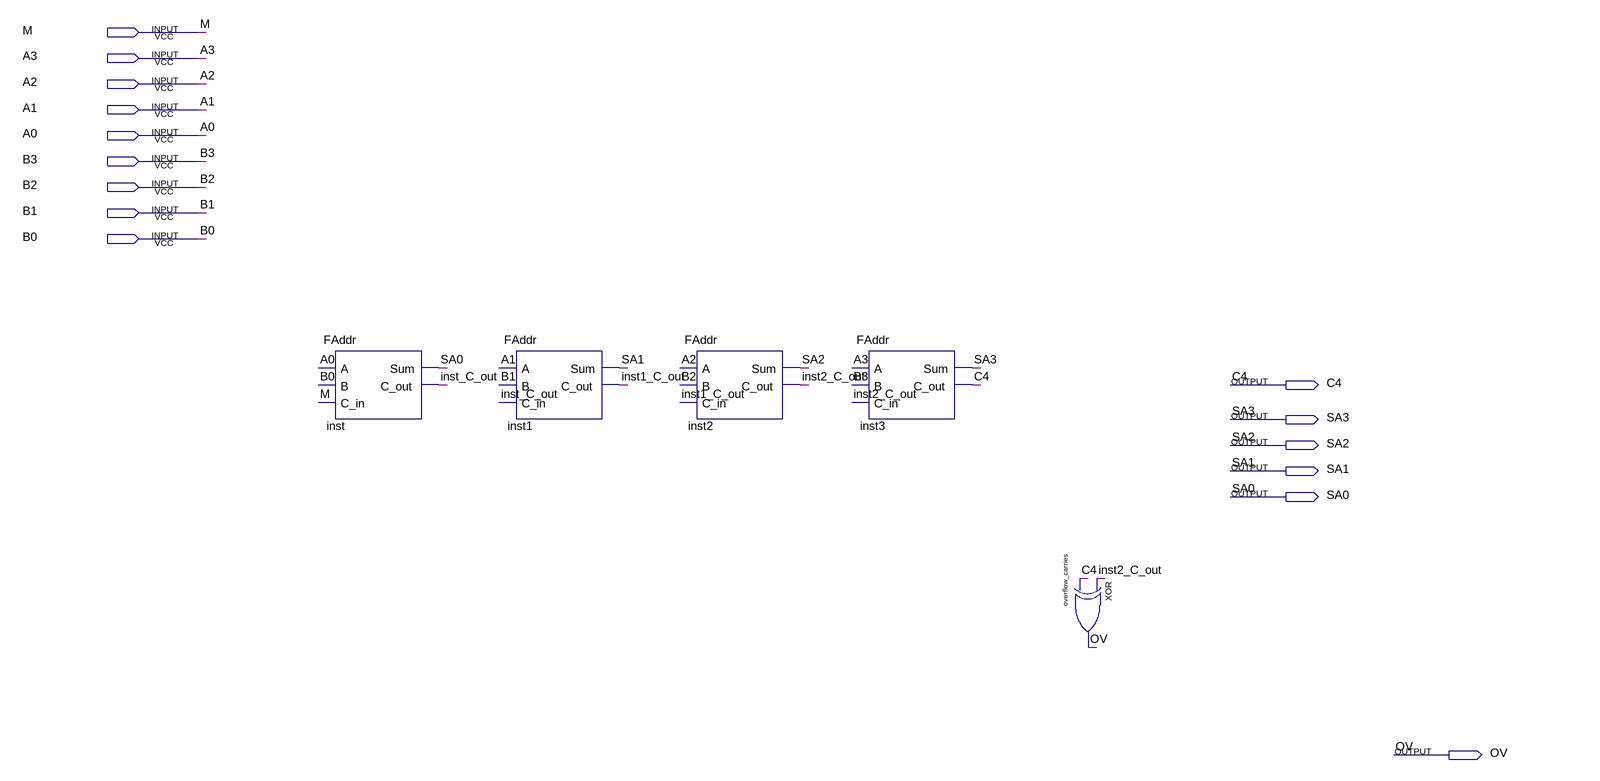
[diagram p0: schematic sheet]
// Quartus schematic ArithmeticAdder.bdf as structural Verilog: 5 symbols, 15 pins
module ArithmeticAdder (
  input  M,
  input  A3,
  input  A2,
  input  A1,
  input  A0,
  input  B3,
  input  B2,
  input  B1,
  input  B0,
  output C4,
  output SA3,
  output SA2,
  output SA1,
  output SA0,
  output OV
);

  wire inst1_C_out, inst2_C_out, inst_C_out;

  FAddr inst (.A(A0), .B(B0), .C_in(M), .Sum(SA0), .C_out(inst_C_out));
  FAddr inst1 (.A(A1), .B(B1), .C_in(inst_C_out), .Sum(SA1), .C_out(inst1_C_out));
  FAddr inst2 (.A(A2), .B(B2), .C_in(inst1_C_out), .Sum(SA2), .C_out(inst2_C_out));
  FAddr inst3 (.A(A3), .B(B3), .C_in(inst2_C_out), .Sum(SA3), .C_out(C4));
  xor overflow_carries (OV, inst2_C_out, C4);
endmodule
